# Altium schematic sheet ADD1299-V3.SchDoc
size 381 x 241 mm; SheetNumber: 1; SheetTotal: 3
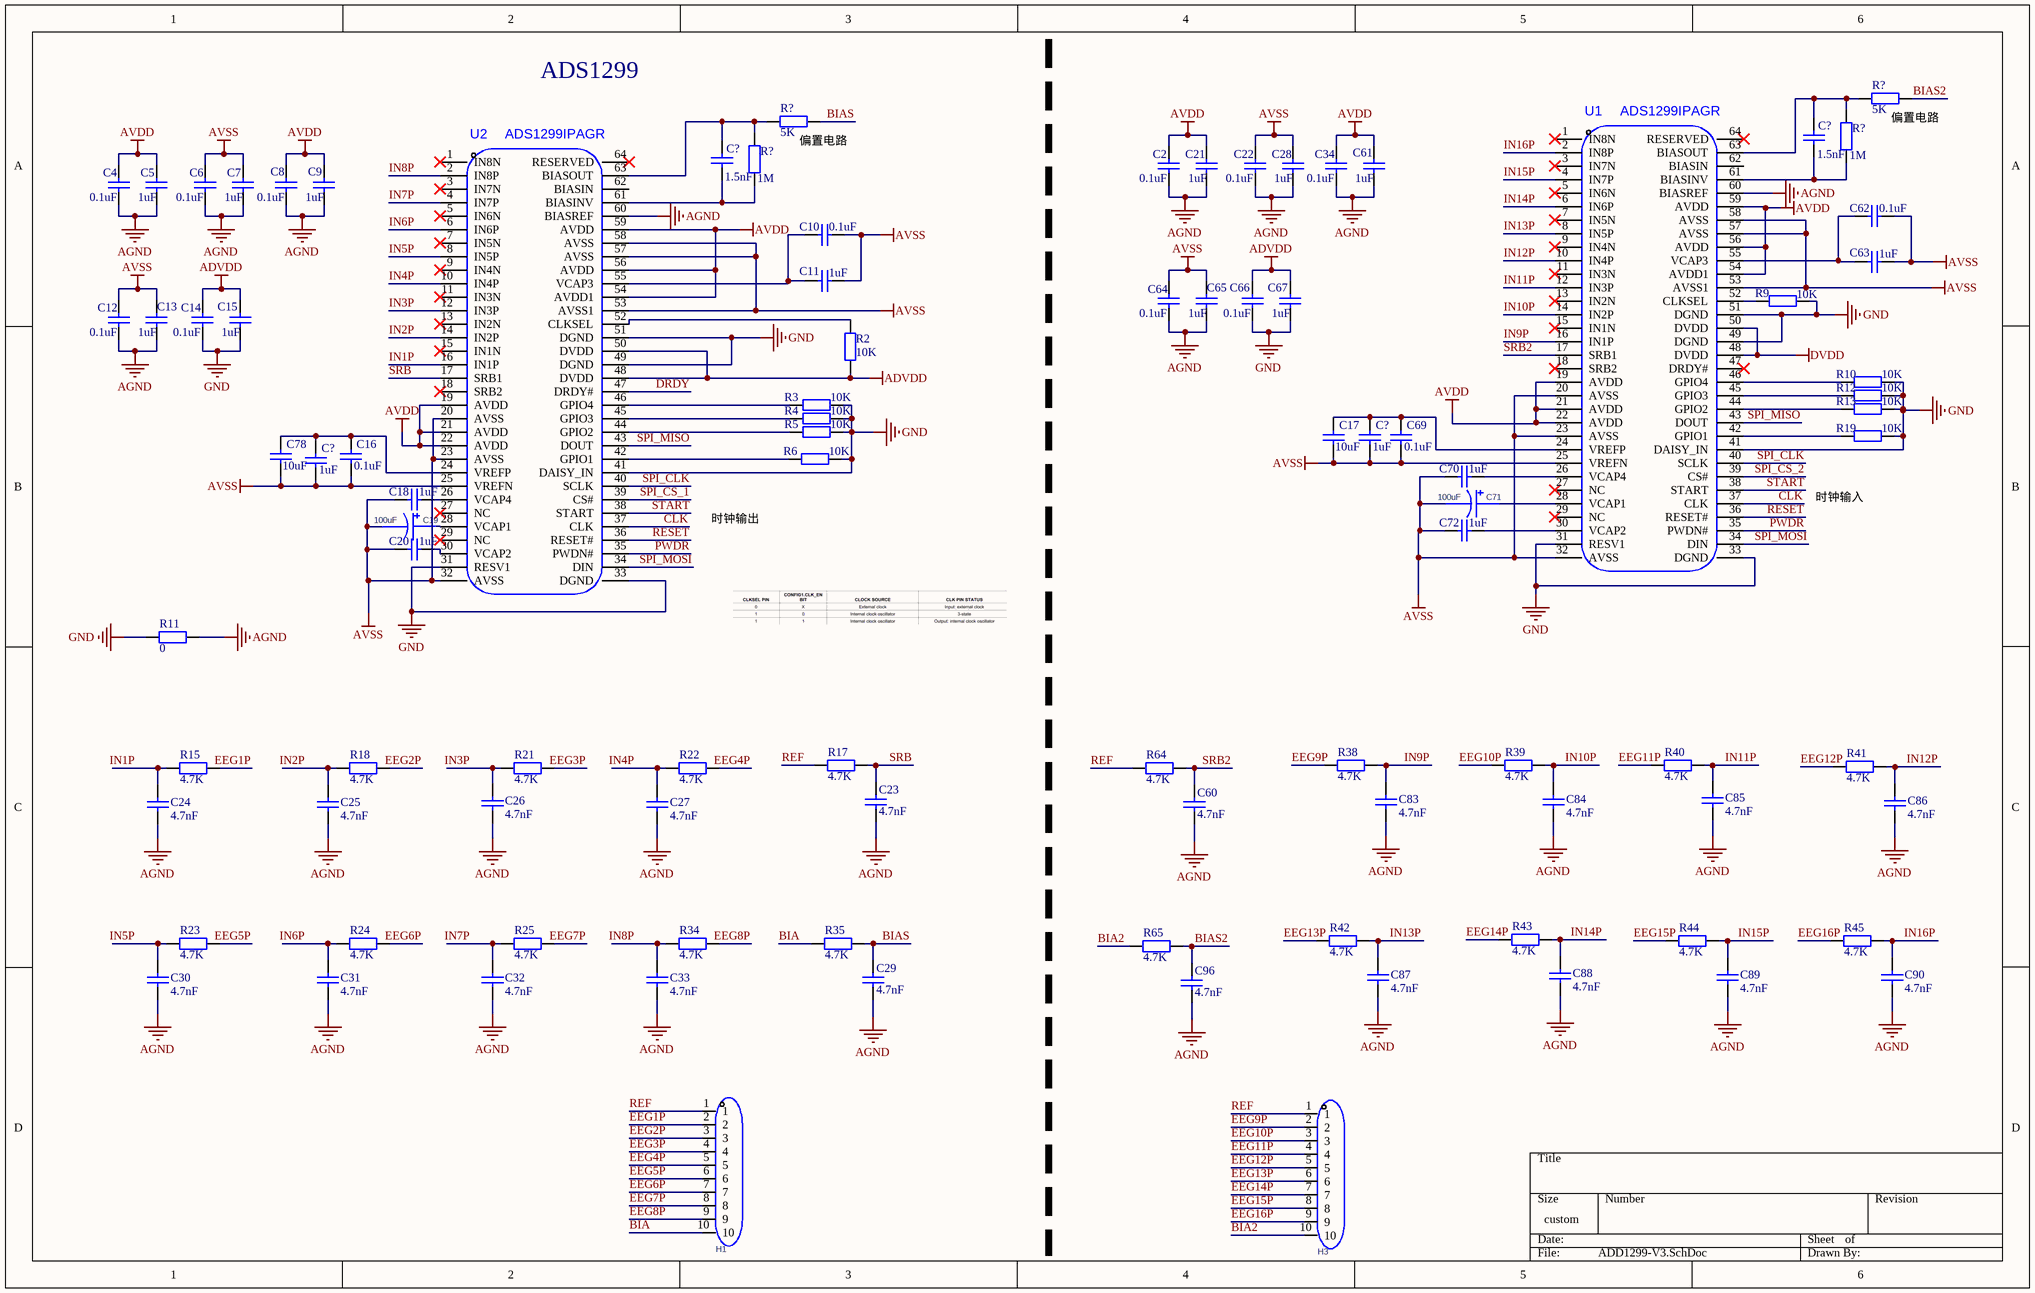
[diagram p0: ADD1299-V3.SchDoc]

## Parts
(Parts that share a designator on the sheet are numbered #1, #2 ... from top to bottom, then left to right.)
C2  0.1uF  [C0603]
C4  0.1uF  [C0603]
C5  1uF  [C0603]
C6  0.1uF  [C0603]
C7  1uF  [C0603]
C8  0.1uF  [C0603]
C9  1uF  [C0603]
C10  0.1uF  [C0603]
C11  1uF  [C0603]
C12  0.1uF  [C0603]
C13  1uF  [C0603]
C14  0.1uF  [C0603]
C15  1uF  [C0603]
C16  0.1uF  [C0603]
C17  10uF  [C0603]
C18  1uF  [C0603]
C19  100uF  [CASE-B_3528]
C20  1uF  [C0603]
C21  1uF  [C0603]
C22  0.1uF  [C0603]
C23  4.7nF  [C0603]
C24  4.7nF  [C0603]
C25  4.7nF  [C0603]
C26  4.7nF  [C0603]
C27  4.7nF  [C0603]
C28  1uF  [C0603]
C29  4.7nF  [C0603]
C30  4.7nF  [C0603]
C31  4.7nF  [C0603]
C32  4.7nF  [C0603]
C33  4.7nF  [C0603]
C34  0.1uF  [C0603]
C60  4.7nF  [C0603]
C61  1uF  [C0603]
C62  0.1uF  [C0603]
C63  1uF  [C0603]
C64  0.1uF  [C0603]
C65  1uF  [C0603]
C66  0.1uF  [C0603]
C67  1uF  [C0603]
C69  0.1uF  [C0603]
C70  1uF  [C0603]
C71  100uF  [CASE-B_3528]
C72  1uF  [C0603]
C78  10uF  [C0603]
C83  4.7nF  [C0603]
C84  4.7nF  [C0603]
C85  4.7nF  [C0603]
C86  4.7nF  [C0603]
C87  4.7nF  [C0603]
C88  4.7nF  [C0603]
C89  4.7nF  [C0603]
C90  4.7nF  [C0603]
C96  4.7nF  [C0603]
C?#1  1.5nF  [C0603]
C?#2  1.5nF  [C0603]
C?#3  1uF  [C0603]
C?#4  1uF  [C0603]
H1  PZ254V-11-10P  [HDR-TH_10P-P2.54-V-M]  (value not drawn)
H3  PZ254V-11-10P  [HDR-TH_10P-P2.54-V-M]  (value not drawn)
R2  10K  [R0603]
R3  10K  [R0603]
R4  10K  [R0603]
R5  10K  [R0603]
R6  10K  [R0603]
R9  10K  [R0603]
R10  10K  [R0603]
R11  0  [R0805]
R12  10K  [R0603]
R13  10K  [R0603]
R15  4.7K  [R0603]
R17  4.7K  [R0603]
R18  4.7K  [R0603]
R19  10K  [R0603]
R21  4.7K  [R0603]
R22  4.7K  [R0603]
R23  4.7K  [R0603]
R24  4.7K  [R0603]
R25  4.7K  [R0603]
R34  4.7K  [R0603]
R35  4.7K  [R0603]
R38  4.7K  [R0603]
R39  4.7K  [R0603]
R40  4.7K  [R0603]
R41  4.7K  [R0603]
R42  4.7K  [R0603]
R43  4.7K  [R0603]
R44  4.7K  [R0603]
R45  4.7K  [R0603]
R64  4.7K  [R0603]
R65  4.7K  [R0603]
R?#1  5K  [R0603]
R?#2  5K  [R0603]
R?#3  1M  [R0603]
R?#4  1M  [R0603]
U1  ADS1299IPAGR  [ADS1299]
U2  ADS1299IPAGR  [ADS1299]

## Nets
ADVDD: C14.1 C15.1 C66.1 C67.1 R2.1 U2.48(DVDD) U2.50(DVDD)
AGND: C2.2 C4.2 C5.2 C6.2 C7.2 C8.2 C9.2 C12.2 C13.2 C21.2 C22.2 C23.1 C24.2 C25.2 C26.2 C27.2 C28.2 C29.1 C30.2 C31.2 C32.2 C33.2 C34.2 C60.1 C61.2 C64.2 C65.2 C83.2 C84.2 C85.2 C86.2 C87.2 C88.2 C89.2 C90.2 C96.1 R11.1 U1.60(BIASREF) U2.60(BIASREF)
AVDD: C2.1 C4.1 C5.1 C8.1 C9.1 C21.1 C34.1 C61.1 U1.19(AVDD) U1.21(AVDD) U1.22(AVDD) U1.54(AVDD1) U1.56(AVDD) U1.59(AVDD) U2.19(AVDD) U2.21(AVDD) U2.22(AVDD) U2.54(AVDD1) U2.56(AVDD) U2.59(AVDD)
AVSS: C6.1 C7.1 C10.2 C11.2 C12.1 C13.1 C16.1 C17.1 C18.1 C19.2 C20.1 C22.1 C28.1 C62.2 C63.2 C64.1 C65.1 C69.1 C70.1 C71.2 C72.1 C78.1 C?#3.1 C?#4.1 U1.20(AVSS) U1.23(AVSS) U1.25(VREFN) U1.32(AVSS) U1.53(AVSS1) U1.57(AVSS) U1.58(AVSS) U2.20(AVSS) U2.23(AVSS) U2.25(VREFN) U2.32(AVSS) U2.53(AVSS1) U2.57(AVSS) U2.58(AVSS)
DVDD: U1.48(DVDD) U1.50(DVDD)
GND: C14.2 C15.2 C66.2 C67.2 R3.2 R4.2 R5.2 R6.2 R9.1 R10.2 R11.2 R12.2 R13.2 R19.2 U1.31(RESV1) U1.33(DGND) U1.41(DAISY_IN) U1.49(DGND) U1.51(DGND) U2.31(RESV1) U2.33(DGND) U2.41(DAISY_IN) U2.49(DGND) U2.51(DGND)
BIA: H1.10 R35.2
BIA2: H3.10 R65.2
BIAS: C29.2 R35.1 R?#2.2
BIAS2: C96.2 R65.1 R?#1.2
CLK: U1.37(CLK) U2.37(CLK)
DRDY: U2.47(DRDY#)
EEG1P: H1.2 R15.1
EEG2P: H1.3 R18.1
EEG3P: H1.4 R21.1
EEG4P: H1.5 R22.1
EEG5P: H1.6 R23.1
EEG6P: H1.7 R24.1
EEG7P: H1.8 R25.1
EEG8P: H1.9 R34.1
EEG9P: H3.2 R38.1
EEG10P: H3.3 R39.1
EEG11P: H3.4 R40.1
EEG12P: H3.5 R41.1
EEG13P: H3.6 R42.1
EEG14P: H3.7 R43.1
EEG15P: H3.8 R44.1
EEG16P: H3.9 R45.1
IN1P: C24.1 R15.2 U2.16(IN1P)
IN2P: C25.1 R18.2 U2.14(IN2P)
IN3P: C26.1 R21.2 U2.12(IN3P)
IN4P: C27.1 R22.2 U2.10(IN4P)
IN5P: C30.1 R23.2 U2.8(IN5P)
IN6P: C31.1 R24.2 U2.6(IN6P)
IN7P: C32.1 R25.2 U2.4(IN7P)
IN8P: C33.1 R34.2 U2.2(IN8P)
IN9P: C83.1 R38.2 U1.16(IN1P)
IN10P: C84.1 R39.2 U1.14(IN2P)
IN11P: C85.1 R40.2 U1.12(IN3P)
IN12P: C86.1 R41.2 U1.10(IN4P)
IN13P: C87.1 R42.2 U1.8(IN5P)
IN14P: C88.1 R43.2 U1.6(IN6P)
IN15P: C89.1 R44.2 U1.4(IN7P)
IN16P: C90.1 R45.2 U1.2(IN8P)
PWDR: U1.35(PWDN#) U2.35(PWDN#)
REF: H1.1 H3.1 R17.2 R64.2
RESET: U1.36(RESET#) U2.36(RESET#)
SPI_CLK: U1.40(SCLK) U2.40(SCLK)
SPI_CS_1: U2.39(CS#)
SPI_CS_2: U1.39(CS#)
SPI_MISO: U1.43(DOUT) U2.43(DOUT)
SPI_MOSI: U1.34(DIN) U2.34(DIN)
SRB: C23.2 R17.1 U2.17(SRB1)
SRB2: C60.2 R64.1 U1.17(SRB1)
START: U1.38(START) U2.38(START)
NetC10_1: C10.1 C11.1 U2.55(VCAP3)
NetC16_2: C16.2 C78.2 C?#4.2 U2.24(VREFP)
NetC17_2: C17.2 C69.2 C?#3.2 U1.24(VREFP)
NetC18_2: C18.2 U2.26(VCAP4)
NetC19_1: C19.1 U2.28(VCAP1)
NetC20_2: C20.2 U2.30(VCAP2)
NetC62_1: C62.1 C63.1 U1.55(VCAP3)
NetC70_2: C70.2 U1.26(VCAP4)
NetC71_1: C71.1 U1.28(VCAP1)
NetC72_2: C72.2 U1.30(VCAP2)
NetC?#1_1: C?#1.1 R?#1.1 R?#3.1 U1.63(BIASOUT)
NetC?#1_2: C?#1.2 R?#3.2 U1.61(BIASINV)
NetC?#2_1: C?#2.1 R?#2.1 R?#4.1 U2.63(BIASOUT)
NetC?#2_2: C?#2.2 R?#4.2 U2.61(BIASINV)
NetR2_2: R2.2 U2.52(CLKSEL)
NetR3_1: R3.1 U2.46(GPIO4)
NetR4_1: R4.1 U2.45(GPIO3)
NetR5_1: R5.1 U2.44(GPIO2)
NetR6_1: R6.1 U2.42(GPIO1)
NetR9_2: R9.2 U1.52(CLKSEL)
NetR10_1: R10.1 U1.46(GPIO4)
NetR12_1: R12.1 U1.45(GPIO3)
NetR13_1: R13.1 U1.44(GPIO2)
NetR19_1: R19.1 U1.42(GPIO1)

Not connected (* = marked no-connect by the designer): U1 1(IN8N)* 3(IN7N)* 5(IN6N)* 7(IN5N)* 9(IN4N)* 11(IN3N)* 13(IN2N)* 15(IN1N)* 18(SRB2)* 27(NC)* 29(NC)* 47(DRDY#)* 62(BIASIN) 64(RESERVED)*; U2 1(IN8N)* 3(IN7N)* 5(IN6N)* 7(IN5N)* 9(IN4N)* 11(IN3N)* 13(IN2N)* 15(IN1N)* 18(SRB2)* 27(NC)* 29(NC)* 62(BIASIN) 64(RESERVED)*

## Notes on the sheet
- ADS1299
- (near R?#2) 偏置电路
- (near R?#1) 偏置电路
- 时钟输入
- 时钟输出

## Library data of the parts
C2 C4 C6 C8 C10 C12 C14 C16 C22 C34 C62 C64 C66 C69 C?#3 C?#4 = C0603: CAP CER 0.1UF 50V, 10% X7R 0603; Value: 104; Published: 8-Jun-2000; LatestRevisionDate: 17-Jul-2002; LatestRevisionNote: Re-released for DXP Platform.; Publisher: Altium Limited
C5 C7 C9 C11 C13 C15 C18 C20 C21 C28 C61 C63 C65 C67 C70 C72 = C0603: CAP CER 1UF 25V, 10% X5R 0603; Value: 104; Published: 8-Jun-2000; LatestRevisionDate: 17-Jul-2002; LatestRevisionNote: Re-released for DXP Platform.; Publisher: Altium Limited
C17 = C0603: AP CER 10UF 10V, 10% X5R 0603; Value: 104; Published: 8-Jun-2000; LatestRevisionDate: 17-Jul-2002; LatestRevisionNote: Re-released for DXP Platform.; Publisher: Altium Limited
C19 C71 = T491B107K010AT: Manufacturer: KEMET(基美); Add into BOM: yes; Tolerance: ±10%; Rated Voltage: 10V; Equivalent Series Resistance(ESR): 1.2Ω@100kHz; Symbol: T491B107K010AT; Device: T491B107K010AT; LCSC Part Name: 100uF ±10% 10V; Supplier Part: C122271; Manufacturer Part: T491B107K010AT; Supplier Footprint: CASE-B-3528; JLCPCB Part Class: Extended Part; Datasheet: https://atta.szlcsc.com/upload/public/pdf/source/20171212/C146203_15130638656111177810.pdf; Supplier: LCSC; Convert to PCB: yes; Value: 100uF; Operating Temperature: -55℃~+125℃
C23-C27 C29-C33 C60 C83-C90 C96 = C0603: CAP CER 4700PF 50V, 10% X7R 0603; Value: 104; Published: 8-Jun-2000; LatestRevisionDate: 17-Jul-2002; LatestRevisionNote: Re-released for DXP Platform.; Publisher: Altium Limited
C78 = C0603: Capacitor; Value: 104; Published: 8-Jun-2000; LatestRevisionDate: 17-Jul-2002; LatestRevisionNote: Re-released for DXP Platform.; Publisher: Altium Limited
C?#1 C?#2 = C0603: CAP CER 1.5NF 25V, 10% X7R 0603; Value: 104; Published: 8-Jun-2000; LatestRevisionDate: 17-Jul-2002; LatestRevisionNote: Re-released for DXP Platform.; Publisher: Altium Limited
H1 H3 = PZ254V-11-10P: Manufacturer: XFCN(兴飞); Add into BOM: yes; Pin Structure: 1x10P; Pitch: 2.54mm; Circluar Pins/Square Pins: 方针; Symbol: PZ254V-11-10P; Device: PZ254V-11-10P; LCSC Part Name: 1x10P 间距:2.54mm 方针 直插; Supplier Part: C492409; Manufacturer Part: PZ254V-11-10P; Supplier Footprint: 插件,P=2.54mm; JLCPCB Part Class: Extended Part; Datasheet: https://atta.szlcsc.com/upload/public/pdf/source/20200309/C492409_129C9431BDD62EBBBD0A643B6AAB9FBD.pdf; Supplier: LCSC; Convert to PCB: yes; Row Spacing: -; Mounting Type: 直插; Number of Rows: 单排; Number of Pins: 10P; Current Rating: -; Voltage Rating (Max): -; Length of Mating Pin: 6mm; Insulation Height: 2.5mm; Length of End Connection Pin: 3mm; Contact Material: 黄铜; Contact Plating: -; Operating Temperature: -40℃~+105℃; Color: 黑色
R2-R6 R9 R10 R12 R13 R19 = R0603: RES 10.0K OHM 1/10W 1% 0603 SMD; Published: 8-Jun-2000; LatestRevisionDate: 17-Jul-2002; LatestRevisionNote: Re-released for DXP Platform.; Publisher: Altium Limited
R11 = R0805: 磁珠; Published: 8-Jun-2000; LatestRevisionDate: 17-Jul-2002; LatestRevisionNote: Re-released for DXP Platform.; Publisher: Altium Limited
R15 R17 R18 R21-R25 R34 R35 R38-R45 R64 R65 = R0603: RES 4.7K OHM 1/10W 1% 0603 SMD; Published: 8-Jun-2000; LatestRevisionDate: 17-Jul-2002; LatestRevisionNote: Re-released for DXP Platform.; Publisher: Altium Limited
R?#1 R?#2 = R0603: 薄膜电阻 5kΩ ±0.1% 100mW; Published: 8-Jun-2000; LatestRevisionDate: 17-Jul-2002; LatestRevisionNote: Re-released for DXP Platform.; Publisher: Altium Limited
R?#3 R?#4 = R0603: RES 1M OHM 1/8W 5% 0603 SMD; Published: 8-Jun-2000; LatestRevisionDate: 17-Jul-2002; LatestRevisionNote: Re-released for DXP Platform.; Publisher: Altium Limited
U1 U2 = ADS1299IPAGR: Manufacturer: TI(德州仪器); Add into BOM: yes; Supply Voltage: 5V；1.8V~3.6V; Symbol: ADS1299IPAGR; Device: ADS1299IPAGR; LCSC Part Name: ADS1299-x 低噪声、4/6/8通道、24bit 、同时采样模数转换器，用于EEG和生物电bit 测量; Supplier Part: C476817; Manufacturer Part: ADS1299IPAGR; Supplier Footprint: TQFP-64(10x10); JLCPCB Part Class: Extended Part; Datasheet: https://www.ti.com/cn/lit/gpn/ads1299; Supplier: LCSC; Convert to PCB: yes